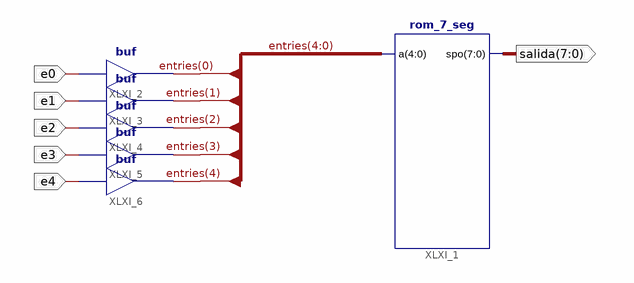
[diagram p0: schematic sheet 1]
// Xilinx ISE schematic decoder.sch (spartan3e) as structural Verilog: 6 symbols, 6 ports
module decoder (
  input  e0,
  input  e1,
  input  e2,
  input  e3,
  input  e4,
  output [7:0] salida
);

  wire [4:0] entries;

  rom_7_seg XLXI_1 (.a(entries), .spo(salida));
  buf XLXI_2 (entries[0], e0);
  buf XLXI_3 (entries[1], e1);
  buf XLXI_4 (entries[2], e2);
  buf XLXI_5 (entries[3], e3);
  buf XLXI_6 (entries[4], e4);
endmodule
